# Altium schematic sheet Temp-Sensor-Sheet.SchDoc
size A4; SheetNumber: 6; SheetTotal: 6
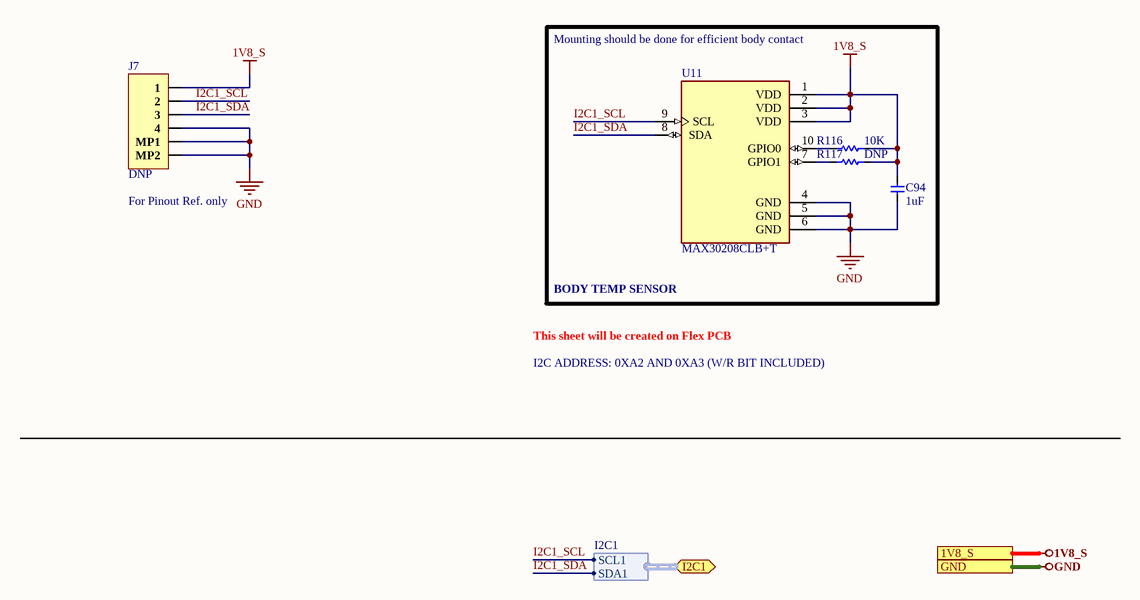
[diagram p0: Temp-Sensor-Sheet.SchDoc]

## Parts
C94  1uF  [CAP-0201]
J7  DNP  [FH19C-4S-0.5SH(10)]
R116  10K  [Res-0201]
R117  DNP  [Res-0201]
U11  MAX30208CLB+T  [IC_MAX30208CLB+T]

## Ports
1V8_S (see Top-Sheet[4B], Controller-Sheet[5D], Power-Sheet[5D], Sensor-Sheet[5D]), GND (see Top-Sheet[4B], Controller-Sheet[5D], GSM-Sheet[5D], Power-Sheet[5D], Sensor-Sheet[5D]), I2C1 (bidir, harness I2C1, see Top-Sheet[5B], Controller-Sheet[4D], Power-Sheet[3D])

## Harnesses
I2C1: SCL1, SDA1

## Nets
1V8_S: C94.2 J7.1 R116.2 R117.2 U11.1(VDD) U11.2(VDD) U11.3(VDD) ; port 1V8_S
GND: C94.1 J7.4 J7.MP1 J7.MP2 U11.4(GND) U11.5(GND) U11.6(GND) ; port GND
I2C1_SCL: J7.2 U11.9(SCL) ; port I2C1.SCL1
I2C1_SDA: J7.3 U11.8(SDA) ; port I2C1.SDA1
NetR116_1: R116.1 U11.10(GPIO0)
NetR117_1: R117.1 U11.7(GPIO1)

## Notes on the sheet
- (near U11) Mounting should be done for efficient body contact
- (near J7) For Pinout Ref. only
- BODY TEMP SENSOR
- I2C ADDRESS: 0XA2 AND 0XA3 (W/R BIT INCLUDED)
- This sheet will be created on Flex PCB
- File:
- Title:
- Date:
- Page
- Num:
- Total:
- Drawn By: Huzaifa Ali

## Library data of the parts
C94 = GRM033R61A105ME15D: CAP CER 1UF 10V X5R 0201; Manufacturer: Murata; Item Type: Capacitors; Material: 4241ConductorMaterial; Dielectric: 1537DielectricType; Supplier: Future Electronics; Supplier Part Number: 2088392; Manufacturer Part Number: GRM033R61A105ME15D; RoHS: Yes; Stock: 3090000; Pricing: 15000=0.0577, 30000=0.0561 (USD); Voltage Rating (DC): 10V; Height: 390um
J7 = FH19C-4S-0.5SH(10): CONN FFC BOTTOM 4POS 0.5MM R/A; Manufacturer: Hirose; Actuator Material: Polymer,Polyphenylene,Liquid Crystal Polymer; Voltage Rating: 50V; Current Rating: 500mA; Number of Positions: 4; Insulation Resistance: 500MR; Wire/Cable Type: Flat Flex; Pitch: 0.02inch; Item Type: FPC Connector; Supplier 1: Digi-Key; Manufacturer Part Number: FH19C-4S-0.5SH(10); RoHS: Yes; Category: FFC / FPC; Stock 1: 7956; Pricing 1: 1=1.08, 10=0.916, 25=0.878, 50=0.8596, 100=0.8221, 250=0.7474, 500=0.67266, 1000=0.59792, 2500=0.54186 (USD); Mounting Technology: Surface Mount; Contact Material: Bronze; Contact Plating: Gold; Housing Material: Polymer; Min Operating Temperature: -55°C; Max Operating Temperature: 85°C; Packaging: Tape and Reel; Package Quantity: 5000; Termination: Solder; Series: FH19C; Flammability Rating: UL94 V-0; RoHS Compliant: Yes; ComponentLink1URL: https://datasheet.ciiva.com/18563/ed-fh19cfh19sc-20140305-18563548.pdf?src-supplier=Digi-Key; ComponentLink1Description: https://datasheet.ciiva.com/18563/ed-fh19cfh19sc-20140305-18563548.pdf?src-supplier=Digi-Key; Supplier Part Number 1: H125822CT-ND; LCSC Part Number: C424650
R116 = 0201WMF1002TEE: 50mW Thick Film Resistors 25V ±1% ±200ppm/℃ 10kΩ 0201 Chip Resistor - Surface Mount ROHS; Manufacturer: UNI-ROYAL; Manufacturer Part Number: 0201WMF1002TEE; Package: 0201; LCSC Part Number: C473048; Item Type: Resistor; ComponentLink1Description: LCSC; ComponentLink1URL: https://www.lcsc.com/product-detail/Chip-Resistor-Surface-Mount_UNI-ROYAL-Uniroyal-Elec-0201WMF1002TEE_C473048.html
R117 = 0201WMF0000TEE: 50mW Thick Film Resistors 25V ±1% 0Ω 0201 Chip Resistor - Surface Mount ROHS; Manufacturer: UNI-ROYAL; Manufacturer Part Number: 0201WMF0000TEE; Package: 0201; LCSC Part Number: C473473; Item Type: Resistor; ComponentLink1Description: LCSC; ComponentLink1URL: https://www.lcsc.com/product-detail/Chip-Resistor-Surface-Mount_UNI-ROYAL-Uniroyal-Elec-0201WMF0000TEE_C473473.html
U11 = MAX30208CLB+T: Temperature Sensor Digital, Local 0Â°C ~ 70Â°C 16 b 10-LGA (2x2); MF: Maxim Integrated; MP: MAX30208CLB+T; SnapEDA_Link: https://www.snapeda.com/parts/MAX30208CLB+T/Maxim+Integrated/view-part/?ref=snap; Availability: In Stock; Package: WFLGA-10 Maxim Integrated; Purchase-URL: https://pricing.snapeda.com/search/part/MAX30208CLB+T/?ref=eda; Check_prices: https://www.snapeda.com/parts/MAX30208CLB+T/Maxim+Integrated/view-part/?ref=eda; Value: *; Price: None